# Altium schematic sheet 09-PMIC QCMI SOM.SchDoc: PMIC
size 558 x 431 mm; Designer: B. Jordan; DsnPath: G:\My Drive\Quilter Computer - Engineering Assets\NXP i.MX8M-Mini\8MMINILPD4-CPU2-DESIGNFILES\8MMINILPD4-CPU2-DESIGNFILES\SCH-47712_A4.DSN; Author: B. Jordan; DrawnBy: B. Jordan; Revision: 0; SheetNumber: 09; SheetTotal: 10; CHK_APP_DATE: --/--/--; DSN_APP_DATE: --/--/--; ENG_APP_DATE: --/--/--
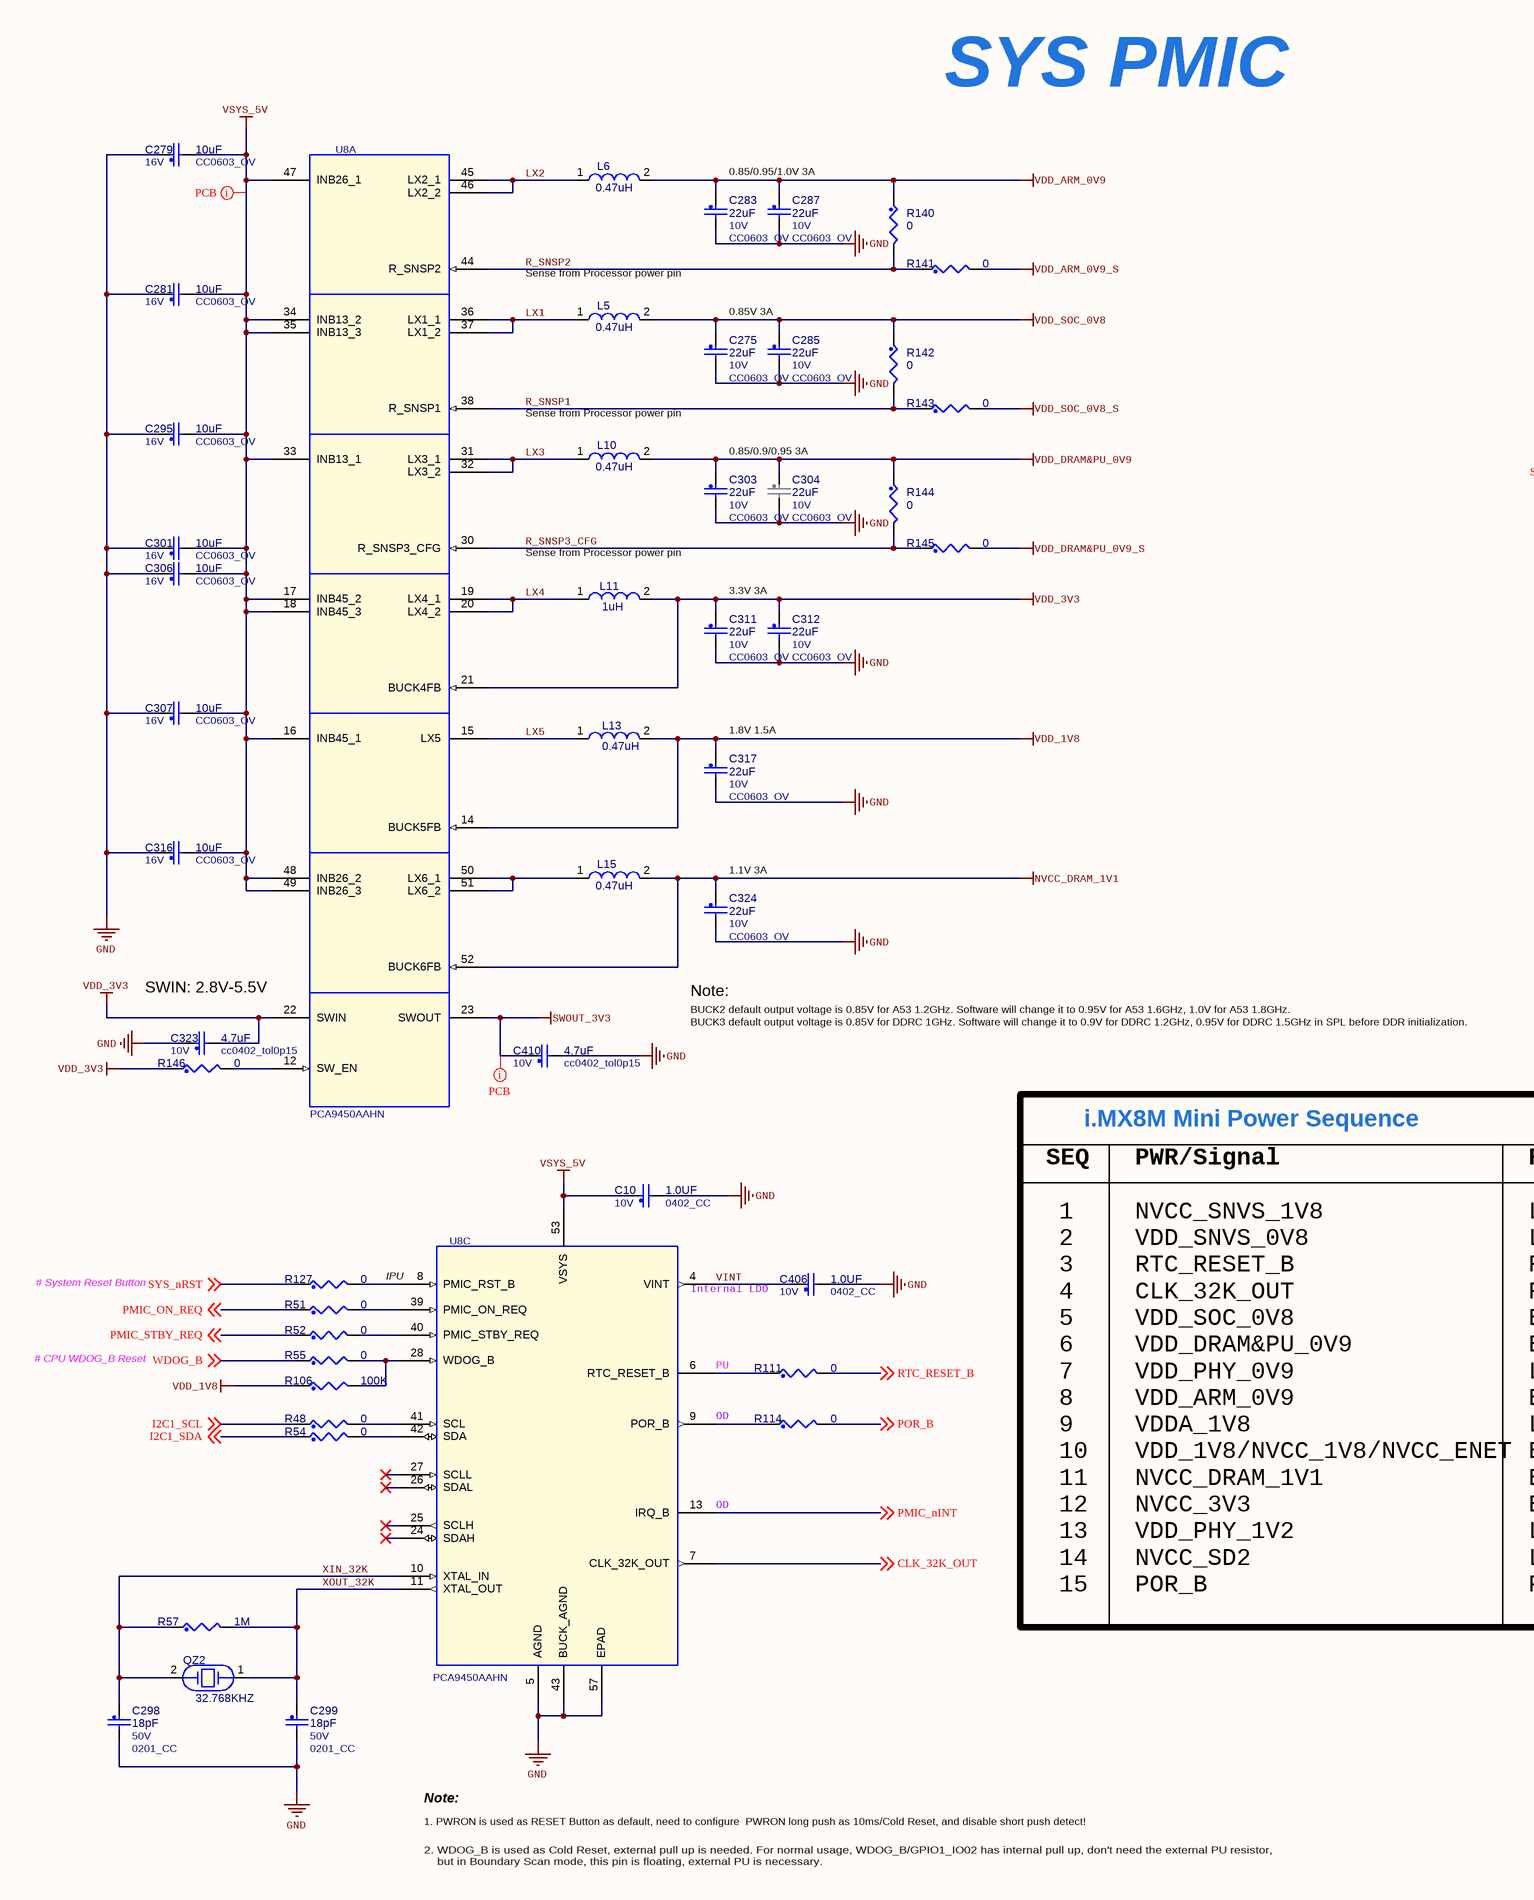
[diagram p0: 09-PMIC QCMI SOM.SchDoc, left]
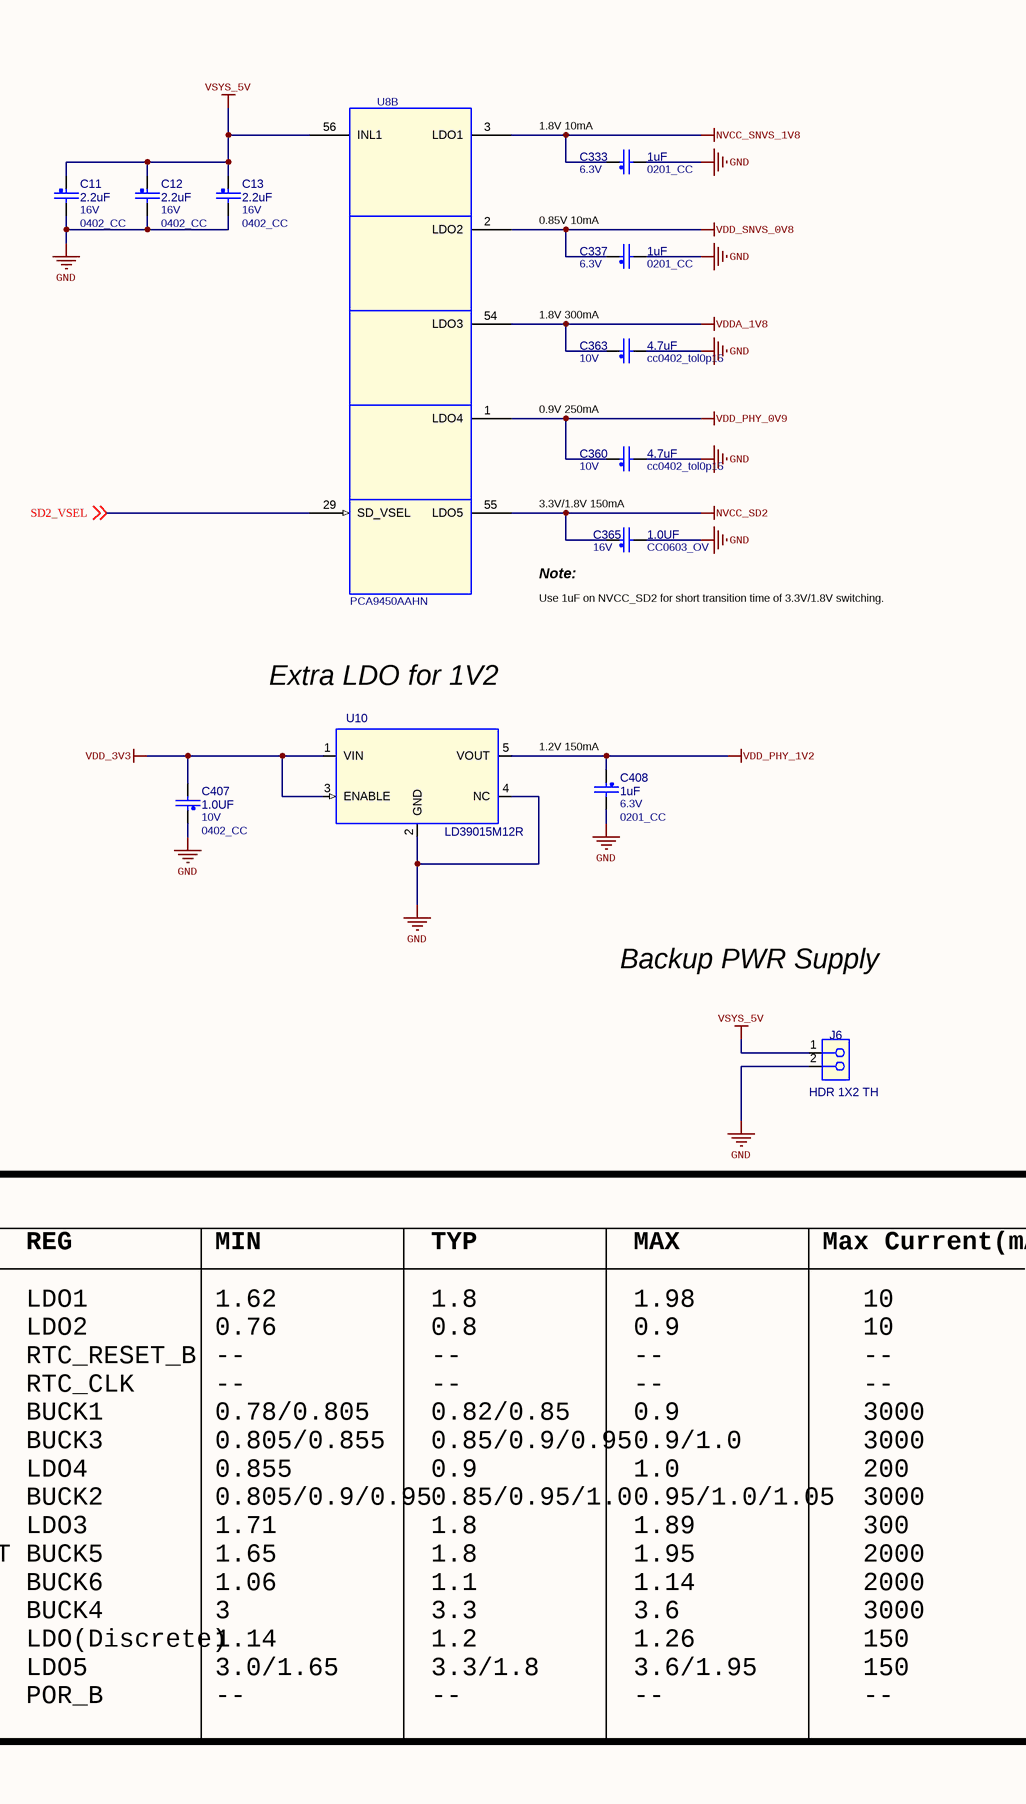
[diagram p1: 09-PMIC QCMI SOM.SchDoc, middle]
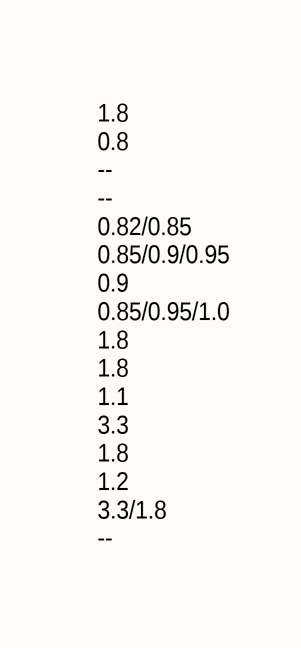
[diagram p2: 09-PMIC QCMI SOM.SchDoc, right]

## Parts
C10  1.0UF  VOLTAGE: 10V  [0402_CC]
C11  2.2uF  VOLTAGE: 16V  [0402_CC]
C12  2.2uF  VOLTAGE: 16V  [0402_CC]
C13  2.2uF  VOLTAGE: 16V  [0402_CC]
C275  22uF  VOLTAGE: 10V  [CC0603_OV]
C279  10uF  VOLTAGE: 16V  [CC0603_OV]
C281  10uF  VOLTAGE: 16V  [CC0603_OV]
C283  22uF  VOLTAGE: 10V  [CC0603_OV]
C285  22uF  VOLTAGE: 10V  [CC0603_OV]
C287  22uF  VOLTAGE: 10V  [CC0603_OV]
C295  10uF  VOLTAGE: 16V  [CC0603_OV]
C298  18pF  VOLTAGE: 50V  [0201_CC]
C299  18pF  VOLTAGE: 50V  [0201_CC]
C301  10uF  VOLTAGE: 16V  [CC0603_OV]
C303  22uF  VOLTAGE: 10V  [CC0603_OV]
C304  22uF  VOLTAGE: 10V  [CC0603_OV]
C306  10uF  VOLTAGE: 16V  [CC0603_OV]
C307  10uF  VOLTAGE: 16V  [CC0603_OV]
C311  22uF  VOLTAGE: 10V  [CC0603_OV]
C312  22uF  VOLTAGE: 10V  [CC0603_OV]
C316  10uF  VOLTAGE: 16V  [CC0603_OV]
C317  22uF  VOLTAGE: 10V  [CC0603_OV]
C323  4.7uF  VOLTAGE: 10V  [cc0402_tol0p15]
C324  22uF  VOLTAGE: 10V  [CC0603_OV]
C333  1uF  VOLTAGE: 6.3V  [0201_CC]
C337  1uF  VOLTAGE: 6.3V  [0201_CC]
C360  4.7uF  VOLTAGE: 10V  [cc0402_tol0p15]
C363  4.7uF  VOLTAGE: 10V  [cc0402_tol0p15]
C365  1.0UF  VOLTAGE: 16V  [CC0603_OV]
C406  1.0UF  VOLTAGE: 10V  [0402_CC]
C407  1.0UF  VOLTAGE: 10V  [0402_CC]
C408  1uF  VOLTAGE: 6.3V  [0201_CC]
C410  4.7uF  VOLTAGE: 10V  [cc0402_tol0p15]
J6  HDR 1X2 TH  [HDR_1X2]
L5  0.47uH  [ind_sph2520]
L6  0.47uH  [ind_sph2520]
L10  0.47uH  [ind_sph2520]
L11  1uH  [ind_sph2520]
L13  0.47uH  [IND_2016A]
L15  0.47uH  [ind_sph2520]
QZ2  32.768KHZ  [XTAL2-3P2X1P5-SM]
R48  0  [0402_CC]
R51  0  [0402_CC]
R52  0  [0402_CC]
R54  0  [0402_CC]
R55  0  [RC0402_25]
R57  1M  [0201_CC]
R106  100K  [0201_CC]
R111  0  [0402_CC]
R114  0  [0402_CC]
R127  0  [RC0402_25]
R140  0  [0402_CC]
R141  0  [0402_CC]
R142  0  [0402_CC]
R143  0  [0402_CC]
R144  0  [0402_CC]
R145  0  [0402_CC]
R146  0  [0402_CC]
U8  PCA9450AAHN  [hvqfn56_0p4_7x7_ep4p7mm]  (parts A,B,C of 3)
U10  LD39015M12R  [sot23-5]

## Nets
GND: C10.2 C11.2 C12.2 C13.2 C275.2 C279.1 C281.1 C283.2 C285.2 C287.2 C295.1 C298.2 C299.2 C301.1 C303.2 C304.2 C306.1 C307.1 C311.2 C312.2 C316.1 C317.2 C323.1 C324.2 C333.2 C337.2 C360.2 C363.2 C365.2 C406.2 C407.1 C408.2 C410.2 J6.2 U8.5(AGND) U8.43(BUCK_AGND) U8.57(EPAD) U10.2(GND) U10.4(NC)
NVCC_DRAM_1V1: C324.1 L15.2 U8.52(BUCK6FB)
NVCC_SD2: C365.1 U8.55(LDO5)
NVCC_SNVS_1V8: C333.1 U8.3(LDO1)
SWOUT_3V3: C410.1 U8.23(SWOUT)
VDD_1V8: C317.1 L13.2 R106.1 U8.14(BUCK5FB)
VDD_3V3: C311.1 C312.1 C323.2 C407.2 L11.2 R146.1 U8.21(BUCK4FB) U8.22(SWIN) U10.1(VIN) U10.3(ENABLE)
VDD_ARM_0V9: C283.1 C287.1 L6.2 R140.1
VDD_ARM_0V9_S: R141.2
VDD_DRAM&PU_0V9: C303.1 C304.1 L10.2 R144.1
VDD_DRAM&PU_0V9_S: R145.2
VDD_PHY_0V9: C360.1 U8.1(LDO4)
VDD_PHY_1V2: C408.1 U10.5(VOUT)
VDD_SNVS_0V8: C337.1 U8.2(LDO2)
VDD_SOC_0V8: C275.1 C285.1 L5.2 R142.1
VDD_SOC_0V8_S: R143.2
VDDA_1V8: C363.1 U8.54(LDO3)
VSYS_5V: C10.1 C11.1 C12.1 C13.1 C279.2 C281.2 C295.2 C301.2 C306.2 C307.2 C316.2 J6.1 U8.16(INB45_1) U8.17(INB45_2) U8.18(INB45_3) U8.33(INB13_1) U8.34(INB13_2) U8.35(INB13_3) U8.47(INB26_1) U8.48(INB26_2) U8.49(INB26_3) U8.53(VSYS) U8.56(INL1)
CLK_32K_OUT: U8.7(CLK_32K_OUT) ; off-sheet CLK_32K_OUT
I2C1_SCL: R48.1 ; off-sheet I2C1_SCL
I2C1_SDA: R54.1 ; off-sheet I2C1_SDA
LX1: L5.1 U8.36(LX1_1) U8.37(LX1_2)
LX2: L6.1 U8.45(LX2_1) U8.46(LX2_2)
LX3: L10.1 U8.31(LX3_1) U8.32(LX3_2)
LX4: L11.1 U8.19(LX4_1) U8.20(LX4_2)
LX5: L13.1 U8.15(LX5)
PMIC_nINT: U8.13(IRQ_B) ; off-sheet PMIC_nINT
PMIC_ON_REQ: R51.1 ; off-sheet PMIC_ON_REQ
PMIC_STBY_REQ: R52.1 ; off-sheet PMIC_STBY_REQ
POR_B: R114.2 ; off-sheet POR_B
R_SNSP1: R142.2 R143.1 U8.38(R_SNSP1)
R_SNSP2: R140.2 R141.1 U8.44(R_SNSP2)
R_SNSP3_CFG: R144.2 R145.1 U8.30(R_SNSP3_CFG)
RTC_RESET_B: R111.2 ; off-sheet RTC_RESET_B
SD2_VSEL: U8.29(SD_VSEL) ; off-sheet SD2_VSEL
SYS_nRST: R127.1 ; off-sheet SYS_nRST
VINT: C406.1 U8.4(VINT)
WDOG_B: R55.1 ; off-sheet WDOG_B
XIN_32K: C298.1 QZ2.2 R57.1 U8.10(XTAL_IN)
XOUT_32K: C299.1 QZ2.1 R57.2 U8.11(XTAL_OUT)
NetL15_1: L15.1 U8.50(LX6_1) U8.51(LX6_2)
NetR48_2: R48.2 U8.41(SCL)
NetR51_2: R51.2 U8.39(PMIC_ON_REQ)
NetR52_2: R52.2 U8.40(PMIC_STBY_REQ)
NetR54_2: R54.2 U8.42(SDA)
NetR55_2: R55.2 R106.2 U8.28(WDOG_B)
NetR111_1: R111.1 U8.6(RTC_RESET_B)
NetR114_1: R114.1 U8.9(POR_B)
NetR127_2: R127.2 U8.8(PMIC_RST_B)
NetR146_2: R146.2 U8.12(SW_EN)

Not connected (* = marked no-connect by the designer): U8 24(SDAH)* 25(SCLH)* 26(SDAL)* 27(SCLL)*

## Layout directives
rule Supply Nets [Voltage = 5.000]; net class POWER: VSYS_5V
rule Supply Nets [Voltage = 3.300]; net class POWER: SWOUT_3V3

## Notes on the sheet
- SYS PMIC
- 1.8V 10mA
- 0.85/0.95/1.0V 3A
- 0.85V 10mA
- Sense from Processor power pin
- 1.8V 300mA
- 0.85V 3A
- 0.9V 250mA
- 0.85/0.9/0.95 3A
- 3.3V/1.8V 150mA
- Use 1uF on NVCC_SD2 for short transition time of 3.3V/1.8V switching.
- (near C365) Note:
- 3.3V 3A
- Extra LDO for 1V2
- (near C317) 1.8V 1.5A
- 1.2V 150mA
- (near C324) 1.1V 3A
- Backup PWR Supply
- SWIN: 2.8V-5.5V
- Note:
- BUCK2 default output voltage is 0.85V for A53 1.2GHz. Software will change it to 0.95V for A53 1.6GHz, 1.0V for A53 1.8GHz.
- BUCK3 default output voltage is 0.85V for DDRC 1GHz. Software will change it to 0.9V for DDRC 1.2GHz, 0.95V for DDRC 1.5GHz in SPL before DDR initialization.
- i.MX8M Mini Power Sequence
- SEQ
- PWR/Signal
- REG
- MIN
- TYP
- MAX
- Max Current(mA)
- # System Reset Button
- IPU
- (near U8) Internal LDO
- # CPU WDOG_B Reset
- PU
- OD
- (near U8) OD
- 1
  2
  3
  4
  5
  6
  7
  8
  9
  10
  11
  12
  13
  14
  15
- NVCC_SNVS_1V8
  VDD_SNVS_0V8
  RTC_RESET_B
  CLK_32K_OUT
  VDD_SOC_0V8
  VDD_DRAM&PU_0V9
  VDD_PHY_0V9
  VDD_ARM_0V9
  VDDA_1V8
  VDD_1V8/NVCC_1V8/NVCC_ENET
  NVCC_DRAM_1V1
  NVCC_3V3
  VDD_PHY_1V2
  NVCC_SD2
  POR_B
- LDO1
  LDO2
  RTC_RESET_B
  RTC_CLK
  BUCK1
  BUCK3
  LDO4
  BUCK2
  LDO3
  BUCK5
  BUCK6
  BUCK4
  LDO(Discrete)
  LDO5
  POR_B
- 1.62
  0.76
  --
  --
  0.78/0.805
  0.805/0.855
  0.855
  0.805/0.9/0.95
  1.71
  1.65
  1.06
  3
  1.14
  3.0/1.65
  --
- 1.8
  0.8
  --
  --
  0.82/0.85
  0.85/0.9/0.95
  0.9
  0.85/0.95/1.0
  1.8
  1.8
  1.1
  3.3
  1.2
  3.3/1.8
  --
- 1.98
  0.9
  --
  --
  0.9
  0.9/1.0
  1.0
  0.95/1.0/1.05
  1.89
  1.95
  1.14
  3.6
  1.26
  3.6/1.95
  --
- 10
  10
  --
  --
  3000
  3000
  200
  3000
  300
  2000
  2000
  3000
  150
  150
  --
- 1.8
  0.8
  --
  --
  0.82/0.85
  0.85/0.9/0.95
  0.9
  0.85/0.95/1.0
  1.8
  1.8
  1.1
  3.3
  1.8
  1.2
  3.3/1.8
  --
- 1. PWRON is used as RESET Button as default, need to configure  PWRON long push as 10ms/Cold Reset, and disable short push detect!
- 2. WDOG_B is used as Cold Reset, external pull up is needed. For normal usage, WDOG_B/GPIO1_IO02 has internal pull up, don't need the external PU resistor,
  but in Boundary Scan mode, this pin is floating, external PU is necessary.
- DWG. NO.
- REV.
- SHT.
- REVISION
- DESCRIPTION
- DATE
- APPROVED
- ENG:
- DSN:
- APPROVALS
- PROJECT
- REFERENCE DOCUMENTS
- BOM:
- CHK:
- TITLE
- ASSY DWG:
- FAB DWG:
- PCB DWG:
- SIZE
- FILE NAME
- C
- SCHEMATIC DOCUMENT NUMBER
- SHEET
- OF
- REV

## Library data of the parts
C10 = CAP_NP: CAP CER 1.0UF 10V 10% X5R 0402; MFG_NAME01: YAGEO AMERICA; MFG_PN01: CC0402KRX5R6BB105; EIA Case: 0402; Value: 1.0UF; ROHS: Yes; PCB Footprint: 0402_CC
C11 = CAP_NP: CAP CER 2.2uF 16V 10% X5R 0402; MFG_NAME01: MURATA; MFG_PN01: GRM155R61C225KE44; EIA Case: 0402; Temp Range: -55°C ~ 85°C; Value: 2.2uF; PCB Footprint: 0402_CC; Tolerance: 10%; ROHS: Yes
C12 C13 = CAP_NP: CAP CER 2.2uF 16V 10% X5R 0402; MFG_PN01: GRM155R61C225KE44; MFG_NAME01: MURATA; EIA Case: 0402; Temp Range: -55°C ~ 85°C; Value: 2.2uF; PCB Footprint: 0402_CC; ROHS: Yes; Tolerance: 10%
C275 C285 C303 C312 C317 C324 = CAP_NP: CAP CER 22uF 10V 20% X5R 0603; MFG_PN01: C1608X5R1A226M080AC; MFG_NAME01: TDK; EIA Case: 0603; Value: 22uF; ROHS: Yes; Tolerance: 20%; PCB Footprint: CC0603_OV
C279 C301 C307 = CAP_NP: CAP CER 10.0uF 16V 10% X5R 0603; MFG_PN01: GRM188R61C106KAALD; MFG_NAME01: MURATA; EIA Case: 0603; Temp Range: -55°C ~ 85°C; Value: 10uF; ROHS: Yes; Tolerance: 10%; PCB Footprint: CC0603_OV
C281 C295 C306 C316 = CAP_NP: CAP CER 10.0uF 16V 10% X5R 0603; MFG_NAME01: MURATA; MFG_PN01: GRM188R61C106KAALD; EIA Case: 0603; Temp Range: -55°C ~ 85°C; Value: 10uF; Tolerance: 10%; ROHS: Yes; PCB Footprint: CC0603_OV
C283 C304 = CAP_NP: CAP CER 22uF 10V 20% X5R 0603; EIA Case: 0603; MFG_NAME01: TDK; MFG_PN01: C1608X5R1A226M080AC; Value: 22uF; Tolerance: 20%; ROHS: Yes; PCB Footprint: CC0603_OV
C287 C311 = CAP_NP: CAP CER 22uF 10V 20% X5R 0603; MFG_NAME01: TDK; MFG_PN01: C1608X5R1A226M080AC; EIA Case: 0603; Value: 22uF; Tolerance: 20%; ROHS: Yes; PCB Footprint: CC0603_OV
C298 = CAP_NP: CAP CER 18pF 50V 5% C0G 0201; EIA Case: 0201; MFG_NAME01: MURATA; MFG_PN01: GRM0335C1H180JA01D; Value: 18pF; Tolerance: 5%; ROHS: Yes; PCB Footprint: 0201_CC
C299 = CAP_NP: CAP CER 18pF 50V 5% C0G 0201; EIA Case: 0201; MFG_PN01: GRM0335C1H180JA01D; MFG_NAME01: MURATA; Value: 18pF; ROHS: Yes; Tolerance: 5%; PCB Footprint: 0201_CC
C323 C363 C410 = CAP_NP: CAP CER 4.7uF 10V 10% X5R 0402; MFG_PN01: CL05A475KP5NRNC; MFG_NAME01: SAMSUNG ELECTRO MECHANICS; EIA Case: 0402; Value: 4.7uF; ROHS: Yes; Tolerance: 10%; PCB Footprint: cc0402_tol0p15
C333 C337 C408 = CAP_NP: CAP CER 1uF 6.3V 20% X5R 0201; MFG_NAME01: AVX; MFG_PN01: 02016D105MAT2A; EIA Case: 0201; Value: 1uF; PCB Footprint: 0201_CC; Tolerance: 20%; ROHS: Yes
C360 = CAP_NP: CAP CER 4.7uF 10V 10% X5R 0402; MFG_NAME01: SAMSUNG ELECTRO MECHANICS; MFG_PN01: CL05A475KP5NRNC; EIA Case: 0402; Value: 4.7uF; Tolerance: 10%; ROHS: Yes; PCB Footprint: cc0402_tol0p15
C365 = CAP_NP: CAP CER 1.0UF 16V 10% X5R 0603; MFG_PN01: C1608X5R1C105K; MFG_NAME01: TDK; EIA Case: 0603; Value: 1.0UF; PCB Footprint: CC0603_OV; ROHS: Yes; Tolerance: 10%
C406 C407 = CAP_NP: CAP CER 1.0UF 10V 10% X5R 0402; EIA Case: 0402; MFG_NAME01: YAGEO AMERICA; MFG_PN01: CC0402KRX5R6BB105; Value: 1.0UF; ROHS: Yes; PCB Footprint: 0402_CC
J6 = CONN_HDR_2X1: HDR 1X2 TH 100MIL SP 339H AU 98L; MFG_PN01: TSW-102-07-G-S; MFG_NAME01: SAMTEC; Temp Range: -55°C ~ 155°C; Value: HDR 1X2 TH; ROHS: Yes; PCB Footprint: HDR_1X2
L5 L15 = INDUCTOR: IND PWR 0.47uH@1MHZ 4.7A 20% SMT; Temp Range: -40°C ~ 125°C; EIA Case: 2520 (Metric); MFG_NAME01: SHENZHEN SUNLORD ELECTRONICS CO., LTD; MFG_PN01: WPN252012ER47MT; Value: 0.47uH; PCB Footprint: ind_sph2520; ROHS: Yes; Tolerance: 20%
L6 = INDUCTOR: IND PWR 0.47uH@1MHZ 4.7A 20% SMT; Temp Range: -40°C ~ 125°C; EIA Case: 2520 (Metric); MFG_PN01: WPN252012ER47MT; MFG_NAME01: SHENZHEN SUNLORD ELECTRONICS CO., LTD; Value: 0.47uH; ROHS: Yes; Tolerance: 20%; PCB Footprint: ind_sph2520
L10 = INDUCTOR: IND PWR 0.47uH@1MHZ 4.7A 20% SMT; Temp Range: -40°C ~ 125°C; MFG_PN01: WPN252012ER47MT; MFG_NAME01: SHENZHEN SUNLORD ELECTRONICS CO., LTD; EIA Case: 2520 (Metric); Value: 0.47uH; PCB Footprint: ind_sph2520; ROHS: Yes; Tolerance: 20%
L11 = INDUCTOR: IND PWR 1uH@1MHZ 4.2A 20% SMT; Temp Range: -40°C ~125°C; EIA Case: 2520 (Metric); MFG_NAME01: SHENZHEN SUNLORD ELECTRONICS CO., LTD; MFG_PN01: WPN252012H1R0MT; Value: 1uH; PCB Footprint: ind_sph2520; ROHS: Yes
L13 = INDUCTOR: IND WW 0.47uH@1MHz 3.4A 20% 2016; Temp Range: -40°C ~ 85°C; VOLTAGE: 20V DC; EIA Case: 2016 (Metric); MFG_PN01: 1286AS-H-R47M=P2; MFG_NAME01: MURATA; Value: 0.47uH; PCB Footprint: IND_2016A; ROHS: Yes; Tolerance: 20%
QZ2 = XTAL: XTAL 32.768KHZ 12.5PF 20PPM 3.2X1.5MM SMT; MFG_NAME01: Abracon Corporation; MFG_PN01: ABS07-32.768KHZ-T; EIA Case: 3215 (Metric); Value: 32.768KHZ; ROHS: Yes; PCB Footprint: XTAL2-3P2X1P5-SM
R48 R52 R54 R114 = RES: RES MF ZERO OHM 1/16W 5% 0402; Temp Range: -55°C ~ 125°C; EIA Case: 0402; MFG_PN01: MCR01MZPJ000; MFG_NAME01: ROHM; Value: 0; ROHS: Yes; Tolerance: 5%; PCB Footprint: 0402_CC; Rated Power: 1/16W
R51 = RES: RES MF ZERO OHM 1/16W 5% 0402; Temp Range: -55°C ~ 125°C; EIA Case: 0402; MFG_NAME01: ROHM; MFG_PN01: MCR01MZPJ000; Value: 0; Tolerance: 5%; ROHS: Yes; PCB Footprint: 0402_CC; Rated Power: 1/16W
R55 = RES: RES MF ZERO OHM 1/16W 5% 0402; EIA Case: 0402; MFG_PN01: MCR01MZPJ000; MFG_NAME01: ROHM; Value: 0; ROHS: Yes; Tolerance: 5%; PCB Footprint: RC0402_25; Rated Power: 1/16W
R57 = RES: RES MF 1.0M 1/20W 5% AEC-Q200 0201; Temp Range: -55°C ~ 125°C; VOLTAGE: 25V; EIA Case: 0201; MFG_NAME01: PANASONIC; MFG_PN01: ERJ-1GNJ105C; Value: 1M; Tolerance: 5%; ROHS: Yes; PCB Footprint: 0201_CC; Rated Power: 1/20W
R106 = RES: RES MF 100K 1/20W 1% 0201; MFG_PN01: RC-0201-104FT; MFG_NAME01: SKYMOS; EIA Case: 0201; Value: 100K; ROHS: Yes; Tolerance: 1%; PCB Footprint: 0201_CC; Rated Power: 1/20W
R111 R140 R144 R146 = RES: RES MF ZERO OHM 1/16W 5% 0402; MFG_PN01: MCR01MZPJ000; MFG_NAME01: ROHM; EIA Case: 0402; Temp Range: -55°C ~ 125°C; Value: 0; ROHS: Yes; Tolerance: 5%; PCB Footprint: 0402_CC; Rated Power: 1/16W
R127 = RES: RES MF ZERO OHM 1/16W 5% 0402; EIA Case: 0402; MFG_NAME01: ROHM; MFG_PN01: MCR01MZPJ000; Value: 0; Tolerance: 5%; ROHS: Yes; PCB Footprint: RC0402_25; Rated Power: 1/16W
R141-R143 R145 = RES: RES MF ZERO OHM 1/16W 5% 0402; MFG_NAME01: ROHM; MFG_PN01: MCR01MZPJ000; EIA Case: 0402; Temp Range: -55°C ~ 125°C; Value: 0; Tolerance: 5%; ROHS: Yes; PCB Footprint: 0402_CC; Rated Power: 1/16W
U8 = PCA9450_HVQFN56P_A: IC POWER MANAGEMENT 2.7-5.5V HVQFN56; MFG_NAME01: NXP SEMICONDUCTORS; Temp Range: -40°C ~ 105°C; JEDEC Case: QFN56; Value: PCA9450AAHN; MFG_PN01: PCA9450AAHN; ROHS: Yes; VOLTAGE: 2.7-5.5V; PCB Footprint: hvqfn56_0p4_7x7_ep4p7mm
U10 = NCV571_5P: IC LIN VREG LDO 1.2V 150mA 1.5-5.5V SOT23-5; MFG_NAME01: ST MICROELECTRONICS; Temp Range: -40°C ~ 125°C; EIA Case: SOT-23; Value: LD39015M12R; PCB Footprint: sot23-5; MFG_PN01: LD39015M12R; ROHS: Yes